# Altium schematic sheet Schematic_Car_TestPoints.SchDoc: WackyRackersCar TestPoints
size A3; DrawnBy: Group 26; Address1: ECE Department; Address2: University of Canterbury; Address3: Christchurch 8041; Address4: New Zealand; Revision: 1; SheetNumber: 4; SheetTotal: 4; ImagePath: \\maxwell\elecapp\AltiumDesigner\Templates\uc-logo.png
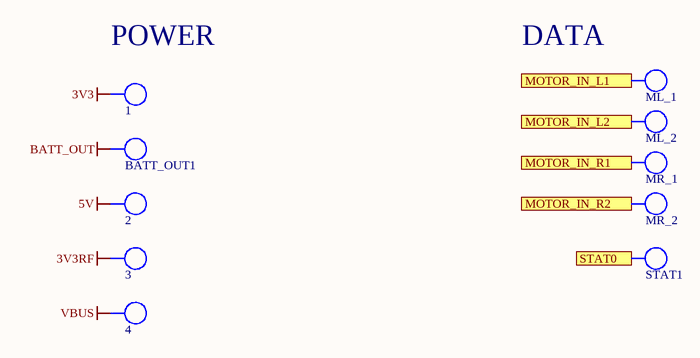
[diagram p0: Schematic_Car_TestPoints.SchDoc]

## Parts
1  TP  [TP_1206]  (value not drawn)  (no BOM)
2  TP  [TP_1206]  (value not drawn)  (no BOM)
3  TP  [TP_1206]  (value not drawn)  (no BOM)
4  TP  [TP_1206]  (value not drawn)  (no BOM)
BATT_OUT1  TP  [TP_1206]  (value not drawn)  (no BOM)
ML_1  TP  [TP_1206]  (value not drawn)  (no BOM)
ML_2  TP  [TP_1206]  (value not drawn)  (no BOM)
MR_1  TP  [TP_1206]  (value not drawn)  (no BOM)
MR_2  TP  [TP_1206]  (value not drawn)  (no BOM)
STAT1  TP  [TP_1206]  (value not drawn)  (no BOM)

## Ports
MOTOR_IN_L1, MOTOR_IN_L2, MOTOR_IN_R1, MOTOR_IN_R2, STAT0

## Nets
3V3: 1.1
3V3RF: 3.1
5V: 2.1
BATT_OUT: BATT_OUT1.1
VBUS: 4.1
MOTOR_IN_L1: ML_1.1 ; port MOTOR_IN_L1
MOTOR_IN_L2: ML_2.1 ; port MOTOR_IN_L2
MOTOR_IN_R1: MR_1.1 ; port MOTOR_IN_R1
MOTOR_IN_R2: MR_2.1 ; port MOTOR_IN_R2
STAT0: STAT1.1 ; port STAT0

## Notes on the sheet
- (near 1) POWER
- DATA
- Title
- Drawn by:
- Date:
- Time:
- Revision:
- Sheet
- of
- File:

## Library data of the parts
1-4 BATT_OUT1 ML_1 ML_2 MR_1 MR_2 STAT1 = TP_1206: Test-Point 3.3x1.6x2.1mm SMD; Manufacturer: Harwin Inc; Manufacturer Part Number: S1751-46R; Manufacturer PN: *; Storage Location: ProtoPlace; Mounting Type: Surface Mount; Type: PC Test Point; Supplier 1: Digi-Key; Supplier Part Number 1: 952-1478-2-ND; Supplier 2: Farnell; Supplier Part Number 2: 1826282; Supplier: ECE Dept; Value: TP